# Altium schematic sheet rev-b1_pod_1_Power.SchDoc
size 297 x 209 mm; Symbol: Drawing-Symbol_A4; @Project Name: Atrium_RevB1; @Page Count: 1; @Update Date: 2026-11-05; @Create Date: 2026-11-05; @Schematic Name: Schematic1; @Page No: 1; @Page Name: P1; Company: Local Forge; Version: V1.0; Page Size: A4; Drawn: Het Bhavsar; Device: Drawing-Symbol_A4; @Create Time: 20:15:11; @Update Time: 20:15:11; Border: 1; Width: 1170; Height: 825; Region Start: 1; X Region Count: 6; Y Region Count: 4; Blade Width: 10; Title Block Position: 3; @Board Name: Board1
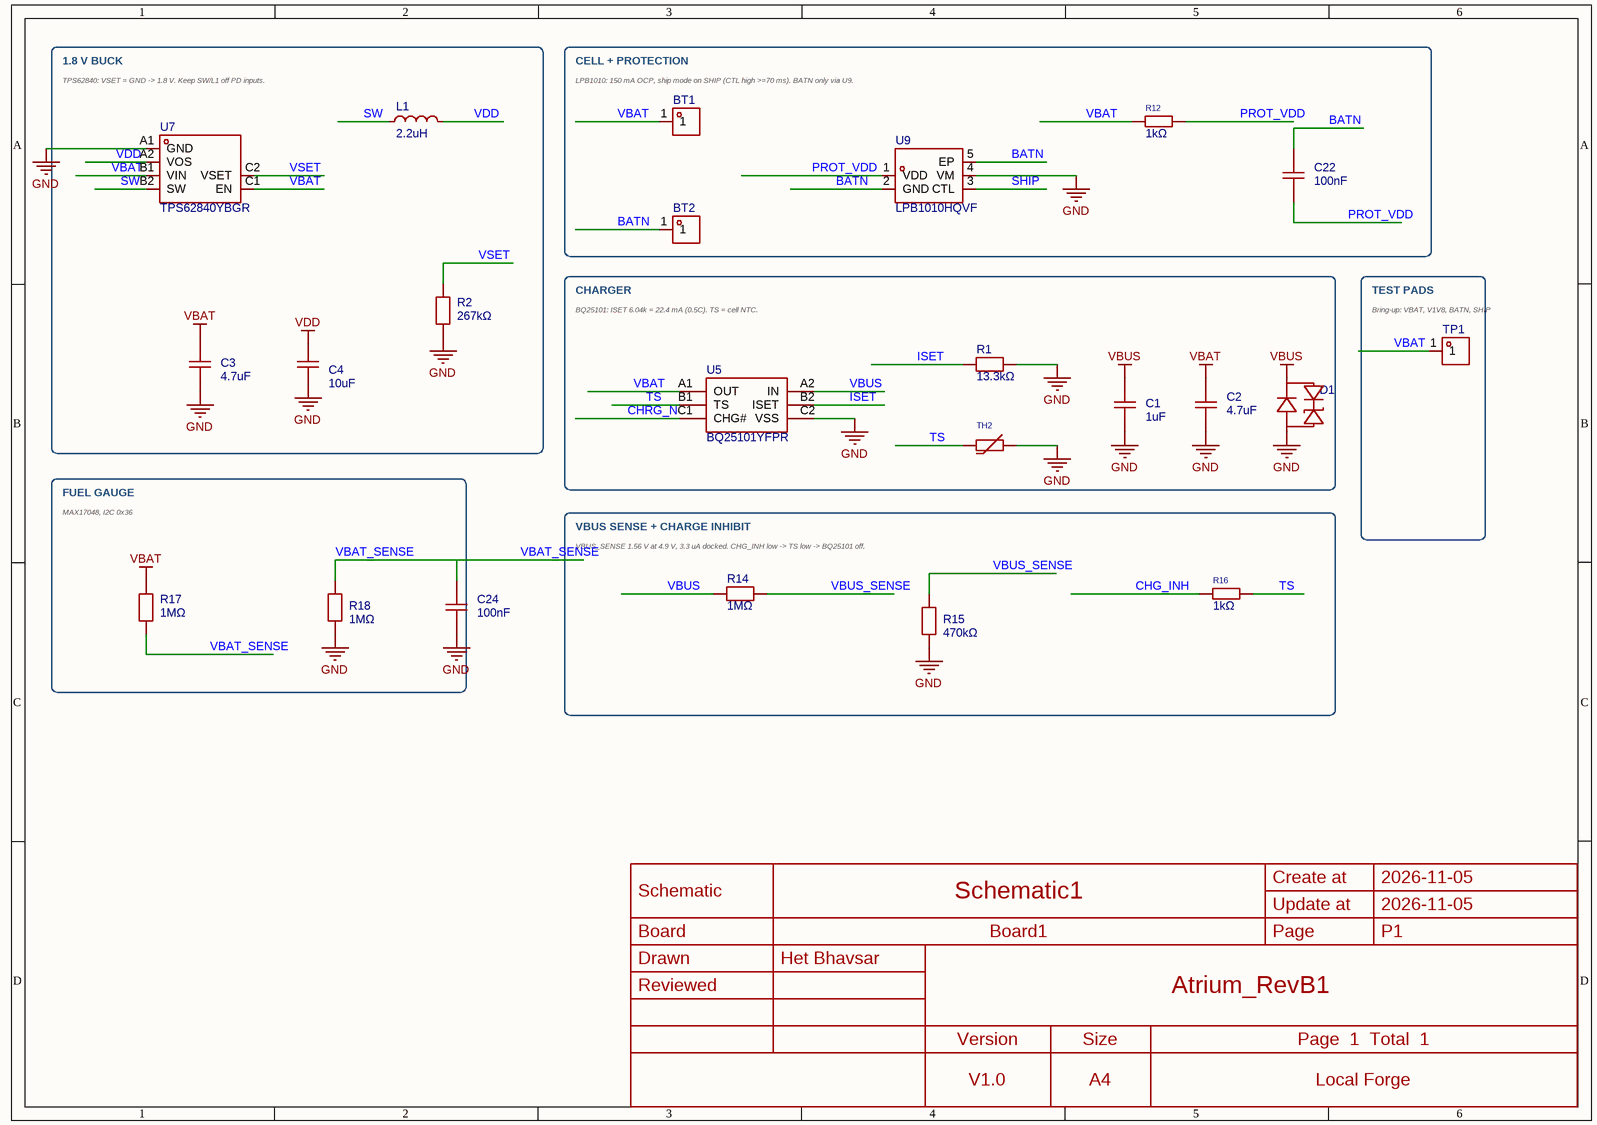
[diagram p0: rev-b1_pod_1_Power.SchDoc]

## Parts
BT1  YZR0154-15039-02  [TESTPOINT-SMD_BD1.5-H3.9]  (value not drawn)
BT2  YZR0154-15039-02  [TESTPOINT-SMD_BD1.5-H3.9]  (value not drawn)
C1  1uF  [C0201]
C2  4.7uF  [C0402]
C3  4.7uF  [C0402]
C4  10uF  [C0402]
C22  100nF  [C0201]
C24  100nF  [C0201]
D1  ESD5V3U04-0201  [X3-DFN0603-2_L0.6-W0.3-RD]  (value not drawn)
L1  2.2uH  [IND-SMD_L1.6-W0.8-1]
R1  13.3kΩ  [R0201]
R2  267kΩ  [R0201]
R12  1kΩ  [R0201]
R14  1MΩ  [R0201]
R15  470kΩ  [R0201]
R16  1kΩ  [R0201]
R17  1MΩ  [R0201]
R18  1MΩ  [R0201]
TH2  NCP03XH103F05RL  [R0201]  (value not drawn)
TP1  YZR0154-15039-02  [TESTPOINT-SMD_BD1.5-H3.9]  (value not drawn)
U5  BQ25101YFPR  [DSBGA-6_L0.9-W1.6-R2-C3-P0.40-BL]
U7  TPS62840YBGR  [DSBGA-6_L1.4-W1.0-R2-C3-P0.40-BL]
U9  LPB1010HQVF  [XDFN-4_L1.0-W1.0-P0.65-BL-EP]

## Blocks framed on the sheet
1.8 V BUCK: C3 C4 L1 R2 U7
CELL + PROTECTION: BT1 BT2 C22 R12 U9
CHARGER: C1 C2 D1 R1 TH2 U5
TEST PADS: TP1
FUEL GAUGE: C24 R17 R18
VBUS SENSE + CHARGE INHIBIT: R14-R16

## Nets
GND: C1.2 C2.2 C3.2 C4.2 C24.1 D1.2(A) R1.2 R2.2 R15.2 R18.2 TH2.2 U5.C2(VSS) U7.A1(GND) U9.4(VM)
VBAT: BT1.1 C2.1 C3.1 R12.1 R17.1 TP1.1 U5.A1(OUT) U7.B1(VIN) U7.C1(EN)
VBUS: C1.1 D1.1(K) R14.1 U5.A2(IN)
VDD: C4.1 L1.2 U7.A2(VOS)
BATN: BT2.1 C22.2 U9.2(GND) U9.5(EP)
CHG_INH: R16.1
CHRG_N: U5.C1(CHG#)
ISET: R1.1 U5.B2(ISET)
PROT_VDD: C22.1 R12.2 U9.1(VDD)
SHIP: U9.3(CTL)
SW: L1.1 U7.B2(SW)
TS: R16.2 TH2.1 U5.B1(TS)
VBAT_SENSE: C24.2 R17.2 R18.1
VBUS_SENSE: R14.2 R15.1
VSET: R2.1 U7.C2(VSET)

## Notes on the sheet
- TPS62840: VSET = GND -> 1.8 V. Keep SW/L1 off PD inputs.
- (near BT1) LPB1010: 150 mA OCP, ship mode on SHIP (CTL high >=70 ms). BATN only via U9.
- BQ25101: ISET 6.04k = 22.4 mA (0.5C). TS = cell NTC.
- (near TP1) Bring-up: VBAT, V1V8, BATN, SHIP
- MAX17048, I2C 0x36
- (near R14) VBUS_SENSE 1.56 V at 4.9 V, 3.3 uA docked. CHG_INH low -> TS low -> BQ25101 off.
- Create at
- 2026-11-05
- Schematic
- Board
- Schematic1
- Board1
- Update at
- Page
- P1
- Drawn
- Reviewed
- Het Bhavsar
- Atrium_RevB1
- Version
- V1.0
- Size
- A4
- Page  1  Total  1
- Local Forge

## Library data of the parts
BT1 BT2 TP1 = YZR0154-15039-02: Type:Pogo Pin Number of Pins:1P Overall Length/Height:3.9mm Operational Height:3.1mm Contact Resistance:50mΩ Elastic Life:10000 times Current Rating:1A Voltage Rating:12V Contact Material:Lead-Free Copper Contact Plating:Gold Operating Temperature:-20℃~+7; Manufacturer: Xinyangze(鑫扬泽); Add into BOM: no; Overall Length/Height: 3.9mm; Operational Height: 3.1mm; Contact Resistance: 50mΩ; Current Rating: 1A; Voltage Rating: 12V; Symbol: YZR0154-15039-02; Device: YZR0154-15039-02; Convert to PCB: no; Manufacturer Part: YZR0154-15039-02; Supplier: LCSC; Supplier Part: C5157388; LCSC Part Name: POGO PIN贴片型弹簧顶针; Supplier Footprint: -; JLCPCB Part Class: Extended Part; Datasheet: https://item.szlcsc.com/datasheet/YZR0154-15039-02/5795506.html; Type: Pogo Pin; Number of Pins: 1P; Elastic Life: 10000 times; Contact Material: Lead-Free Copper; Contact Plating: Gold; Operating Temperature: -20℃~+70℃; FootprintName: TESTPOINT-SMD_BD1.5-H3.9
C1 = GRM033R61A105ME15D: Capacitance:1uF Tolerance:±20% Tolerance:±20% Voltage Rating:10V Temperature Coefficient:X5R; Manufacturer: muRata(村田); Add into BOM: yes; Tolerance: ±20%; Voltage Rating: 10V; Temperature Coefficient: X5R; ModelId: c3e75c3d90204c70b153866ab54c789f0819f05c4eef4c71ace90d822a990e87; ModelName: C0201_L0.6-W0.3-H0.3; ModelTransform: 23.622,11.811,0,0,0,0,0,0,0; Symbol: GRM033R61A105ME15D; Device: GRM033R61A105ME15D; Convert to PCB: yes; Manufacturer Part: GRM033R61A105ME15D; Supplier: LCSC; Supplier Part: C181054; LCSC Part Name: 1uF ±20% 10V; Supplier Footprint: 0201; JLCPCB Part Class: Extended Part; Datasheet: https://item.szlcsc.com/datasheet/GRM033R61A105ME15D/192451.html; Value: 1uF; FootprintName: C0201
C2 C3 = CL05A475MP5NRNC: Capacitance:4.7uF Tolerance:±20% Tolerance:±20% Voltage Rating:10V Temperature Coefficient:X5R; Manufacturer: SAMSUNG(三星); Add into BOM: yes; Tolerance: ±20%; Voltage Rating: 10V; Temperature Coefficient: X5R; ModelId: b7d13df3e9464d7a99d0651d1a5b4d570819f05c4eef4c71ace90d822a990e87; ModelName: C0402_L1.0-W0.5-H0.5; ModelTransform: 39.37,19.685,0,0,0,0,0,0,0; Symbol: CL05A475MP5NRNC; Device: CL05A475MP5NRNC; Convert to PCB: yes; Manufacturer Part: CL05A475MP5NRNC; Supplier: LCSC; Supplier Part: C23733; LCSC Part Name: 4.7uF ±20% 10V; Supplier Footprint: 0402; JLCPCB Part Class: Basic Part; Datasheet: https://item.szlcsc.com/datasheet/CL05A475MP5NRNC/24469.html; Value: 4.7uF; FootprintName: C0402
C4 = CL05A106MQ5NUNC: Capacitance:10uF Tolerance:±20% Tolerance:±20% Voltage Rating:6.3V Temperature Coefficient:X5R; Manufacturer: SAMSUNG(三星); Add into BOM: yes; Tolerance: ±20%; Voltage Rating: 6.3V; Temperature Coefficient: X5R; ModelId: b7d13df3e9464d7a99d0651d1a5b4d570819f05c4eef4c71ace90d822a990e87; ModelName: C0402_L1.0-W0.5-H0.5; ModelTransform: 39.37,19.685,0,0,0,0,0,0,0; Symbol: CL05A106MQ5NUNC; Device: CL05A106MQ5NUNC; Convert to PCB: yes; Manufacturer Part: CL05A106MQ5NUNC; Supplier: LCSC; Supplier Part: C15525; LCSC Part Name: 10uF ±20% 6.3V; Supplier Footprint: 0402; JLCPCB Part Class: Basic Part; Datasheet: https://item.szlcsc.com/datasheet/CL05A106MQ5NUNC/16204.html; Value: 10uF; FootprintName: C0402
C22 = CL03A104KO3NNNC: Capacitance:100nF Tolerance:±10% Tolerance:±10% Voltage Rating:16V Temperature Coefficient:X5R; Manufacturer: SAMSUNG(三星); Add into BOM: yes; Tolerance: ±10%; Voltage Rating: 16V; Temperature Coefficient: X5R; ModelId: c3e75c3d90204c70b153866ab54c789f0819f05c4eef4c71ace90d822a990e87; ModelName: C0201_L0.6-W0.3-H0.3; ModelTransform: 23.622,11.811,0,0,0,0,0,0,0; Symbol: CL03A104KO3NNNC; Device: CL03A104KO3NNNC; Convert to PCB: yes; Manufacturer Part: CL03A104KO3NNNC; Supplier: LCSC; Supplier Part: C307380; LCSC Part Name: 100nF ±10% 16V; Supplier Footprint: 0201; JLCPCB Part Class: Extended Part; Datasheet: https://item.szlcsc.com/datasheet/CL03A104KO3NNNC/291054.html; Value: 100nF; FootprintName: C0201
C24 = CL03A104KO3NNNC: Capacitance:100nF Tolerance:±10% Tolerance:±10% Voltage Rating:16V Temperature Coefficient:X5R; Manufacturer: SAMSUNG(三星); Add into BOM: yes; 3D Model: c3e75c3d90204c70b153866ab54c789f0819f05c4eef4c71ace90d822a990e87; 3D Model Transform: 23.622,11.811,0,0,0,0,0,0,0; Tolerance: ±10%; Voltage Rating: 16V; Temperature Coefficient: X5R; ModelName: C0201_L0.6-W0.3-H0.3; Symbol: CL03A104KO3NNNC; Device: CL03A104KO3NNNC; Convert to PCB: yes; LCSC Part Name: 100nF ±10% 16V; Supplier Part: C307380; Manufacturer Part: CL03A104KO3NNNC; Supplier Footprint: 0201; JLCPCB Part Class: Extended Part; Datasheet: https://item.szlcsc.com/datasheet/CL03A104KO3NNNC/291054.html; Supplier: LCSC; Value: 100nF; FootprintName: C0201
D1 = ESD5V3U04-0201: Polarity:Unidirectional Reverse Stand-Off Voltage (Vrwm):5.3V Clamping Voltage:15V Peak Pulse Current (Ipp):3A@8/20us Reverse Leakage Current (Ir):10nA level of protection:IEC 61000-4-4；IEC 61000-4-5；IEC 61000-4-2 Type:ESD Junction Capacitance:0.4pF; Manufacturer: TECH PUBLIC(台舟); Add into BOM: yes; Reverse Stand-Off Voltage (Vrwm): 5.3V; Clamping Voltage: 15V; Reverse Leakage Current (Ir): 10nA; Type: ESD; Junction Capacitance: 0.4pF; ModelId: 3709796f0342448b909f7538c3b856250819f05c4eef4c71ace90d822a990e87; ModelName: X3-DFN0603-2_L0.6-W0.3-H0.3-RD; ModelTransform: 26.18105,15.39367,0,0,0,0,0,0,0; Symbol: ESD5V3U04-0201; Device: ESD5V3U04-0201; Convert to PCB: yes; Manufacturer Part: ESD5V3U04-0201; Supplier: LCSC; Supplier Part: C521889; LCSC Part Name: 单向 5.3V截止; Supplier Footprint: 0201; JLCPCB Part Class: Extended Part; Datasheet: https://item.szlcsc.com/datasheet/ESD5V3U04-0201/539383.html; Polarity: Unidirectional; Peak Pulse Current (Ipp): 3A@8/20us; level of protection: IEC 61000-4-4；IEC 61000-4-5；IEC 61000-4-2; FootprintName: X3-DFN0603-2_L0.6-W0.3-RD
L1 = SLO160808T2R2MTT: Inductance:2.2uH Tolerance:±20% Tolerance:±20% Current Rating:900mA Current - Saturation(Isat):1.2A DC Resistance(DCR):250mΩ Type:Wire-wound inductor Application Grade:消费级; Manufacturer: Sunltech(顺磁); Add into BOM: yes; Tolerance: ±20%; Current Rating: 900mA; Current - Saturation(Isat): 1.2A; DC Resistance(DCR): 250mΩ; Application Grade: 消费级; ModelId: 23e747ab76974f20a953a6f46bb1be7d0819f05c4eef4c71ace90d822a990e87; ModelTransform: 62.992,31.496,0,0,0,0,0,-0.005,0; Symbol: SLO160808T2R2MTT; Device: SLO160808T2R2MTT; Convert to PCB: yes; Manufacturer Part: SLO160808T2R2MTT; Supplier: LCSC; Supplier Part: C5224594; LCSC Part Name: 2.2uH ±20%; Supplier Footprint: 0603; JLCPCB Part Class: Extended Part; Datasheet: https://item.szlcsc.com/datasheet/SLO160808T2R2MTT/5927620.html; Value: 2.2uH; Type: Wire-wound inductor; FootprintName: IND-SMD_L1.6-W0.8-1; ModelName: IND-SMD_L1.6-W0.8-1
R1 = 0201WMF1332TEE: Type:Thick Film Resistor Resistance:13.3kΩ Tolerance:±1% Tolerance:±1% Power(Watts):50mW Voltage-Supply(Max):25V Temperature Coefficient:±200ppm/℃ Temperature Coefficient:±200ppm/℃ Operating Temperature:-55℃~+155℃ Operating Temperature:-55℃~+155℃; Manufacturer: UNI-ROYAL(厚声); Add into BOM: yes; Tolerance: ±1%; Power(Watts): 50mW; Voltage-Supply(Max): 25V; ModelId: d3c6830bf3df48b598874c11a7d9c8170819f05c4eef4c71ace90d822a990e87; ModelName: R0201_L0.6-W0.3-H0.3; ModelTransform: 23.622,11.811,0,0,0,0,0,-0.0005,0; Symbol: 0201WMF1332TEE; Device: 0201WMF1332TEE; Convert to PCB: yes; Manufacturer Part: 0201WMF1332TEE; Supplier: LCSC; Supplier Part: C423749; LCSC Part Name: 13.3kΩ ±1% 50mW 厚膜电阻; Supplier Footprint: 0201; JLCPCB Part Class: Extended Part; Datasheet: https://item.szlcsc.com/datasheet/0201WMF1332TEE/416699.html; Type: Thick Film Resistor; Value: 13.3kΩ; Temperature Coefficient: ±200ppm/℃; Operating Temperature: -55℃~+155℃; FootprintName: R0201
R2 = 0201WMF2673TEE: Type:Thick Film Resistor Resistance:267kΩ Tolerance:±1% Tolerance:±1% Power(Watts):50mW Voltage-Supply(Max):25V Temperature Coefficient:±200ppm/℃ Temperature Coefficient:±200ppm/℃ Operating Temperature:-55℃~+155℃ Operating Temperature:-55℃~+155℃; Manufacturer: UNI-ROYAL(厚声); Add into BOM: yes; Tolerance: ±1%; Power(Watts): 50mW; Voltage-Supply(Max): 25V; ModelId: d3c6830bf3df48b598874c11a7d9c8170819f05c4eef4c71ace90d822a990e87; ModelName: R0201_L0.6-W0.3-H0.3; ModelTransform: 23.622,11.811,0,0,0,0,0,-0.0005,0; Symbol: 0201WMF2673TEE; Device: 0201WMF2673TEE; Convert to PCB: yes; Manufacturer Part: 0201WMF2673TEE; Supplier: LCSC; Supplier Part: C423627; LCSC Part Name: 267kΩ ±1% 50mW 厚膜电阻; Supplier Footprint: 0201; JLCPCB Part Class: Extended Part; Datasheet: https://item.szlcsc.com/datasheet/0201WMF2673TEE/416577.html; Type: Thick Film Resistor; Value: 267kΩ; Temperature Coefficient: ±200ppm/℃; Operating Temperature: -55℃~+155℃; FootprintName: R0201
R12 = 0201WMF1001TEE: Type:Thick Film Resistor Resistance:1kΩ Tolerance:±1% Tolerance:±1% Power(Watts):50mW Voltage-Supply(Max):25V Temperature Coefficient:±200ppm/℃ Temperature Coefficient:±200ppm/℃ Operating Temperature:-55℃~+155℃ Operating Temperature:-55℃~+155℃; Manufacturer: UNI-ROYAL(厚声); Add into BOM: yes; Tolerance: ±1%; Power(Watts): 50mW; Voltage-Supply(Max): 25V; ModelId: d3c6830bf3df48b598874c11a7d9c8170819f05c4eef4c71ace90d822a990e87; ModelName: R0201_L0.6-W0.3-H0.3; ModelTransform: 23.622,11.811,0,0,0,0,0,-0.0005,0; Symbol: 0201WMF1001TEE; Device: 0201WMF1001TEE; Convert to PCB: yes; Manufacturer Part: 0201WMF1001TEE; Supplier: LCSC; Supplier Part: C270365; Value: 1kΩ; JLCPCB Part Class: Extended Part; LCSC Part Name: 1kΩ ±1% 50mW 厚膜电阻; Supplier Footprint: 0201; Datasheet: https://item.szlcsc.com/datasheet/0201WMF1001TEE/259895.html; Type: Thick Film Resistor; Temperature Coefficient: ±200ppm/℃; Operating Temperature: -55℃~+155℃; FootprintName: R0201
R14 = 0201WMF1004TEE: Type:Thick Film Resistors Resistance:1MΩ Tolerance:±1% Tolerance:±1% Power(Watts): Overload Voltage (Max): Temperature Coefficient:±200ppm/℃ Temperature Coefficient:±200ppm/℃ Operating Temperature Range:-55℃~+155℃ Operating Temperature Range:-55℃~+155℃; Manufacturer: UNI-ROYAL(厚声); Add into BOM: yes; Tolerance: ±1%; ModelId: d3c6830bf3df48b598874c11a7d9c8170819f05c4eef4c71ace90d822a990e87; ModelName: R0201_L0.6-W0.3-H0.3; ModelTransform: 23.622,11.811,0,0,0,0,0,-0.0005,0; Symbol: 0201WMF1004TEE; Device: 0201WMF1004TEE; Convert to PCB: yes; Manufacturer Part: 0201WMF1004TEE; Supplier: LCSC; Supplier Part: C473482; LCSC Part Name: 1MΩ ±1% 50mW 厚膜电阻; Supplier Footprint: 0201; JLCPCB Part Class: Extended Part; Datasheet: https://atta.szlcsc.com/upload/public/pdf/source/20200306/C422600_1E6D84923E4A46A82E41ADD87F860B5C.pdf; Type: Thick Film Resistors; Value: 1MΩ; Temperature Coefficient: ±200ppm/℃; Operating Temperature Range: -55℃~+155℃; FootprintName: R0201
R15 = 0201WMF4703TEE: Type:Thick Film Resistor Resistance:470kΩ Tolerance:±1% Tolerance:±1% Power(Watts):50mW Voltage-Supply(Max):25V Temperature Coefficient:±200ppm/℃ Temperature Coefficient:±200ppm/℃ Operating Temperature:-55℃~+155℃ Operating Temperature:-55℃~+155℃; Manufacturer: UNI-ROYAL(厚声); Add into BOM: yes; Tolerance: ±1%; Power(Watts): 50mW; Voltage-Supply(Max): 25V; ModelId: d3c6830bf3df48b598874c11a7d9c8170819f05c4eef4c71ace90d822a990e87; ModelName: R0201_L0.6-W0.3-H0.3; ModelTransform: 23.622,11.811,0,0,0,0,0,-0.0005,0; Symbol: 0201WMF4703TEE; Device: 0201WMF4703TEE; Convert to PCB: yes; Manufacturer Part: 0201WMF4703TEE; Supplier: LCSC; Supplier Part: C473560; LCSC Part Name: 470kΩ ±1% 50mW 厚膜电阻; Supplier Footprint: 0201; JLCPCB Part Class: Extended Part; Datasheet: https://item.szlcsc.com/datasheet/0201WMF4703TEE/479953.html; Type: Thick Film Resistor; Value: 470kΩ; Temperature Coefficient: ±200ppm/℃; Operating Temperature: -55℃~+155℃; FootprintName: R0201
R16 = 0201WMF1001TEE: Type:Thick Film Resistor Resistance:1kΩ Tolerance:±1% Tolerance:±1% Power(Watts):50mW Voltage-Supply(Max):25V Temperature Coefficient:±200ppm/℃ Temperature Coefficient:±200ppm/℃ Operating Temperature:-55℃~+155℃ Operating Temperature:-55℃~+155℃; Manufacturer: UNI-ROYAL(厚声); Add into BOM: yes; 3D Model: d3c6830bf3df48b598874c11a7d9c8170819f05c4eef4c71ace90d822a990e87; 3D Model Transform: 23.622,11.811,0,0,0,0,0,-0.0005,0; Tolerance: ±1%; Power(Watts): 50mW; Voltage-Supply(Max): 25V; ModelName: R0201_L0.6-W0.3-H0.3; Symbol: 0201WMF1001TEE; Device: 0201WMF1001TEE; Convert to PCB: yes; LCSC Part Name: 1kΩ ±1% 50mW 厚膜电阻; Supplier Footprint: 0201; Datasheet: https://item.szlcsc.com/datasheet/0201WMF1001TEE/259895.html; Type: Thick Film Resistor; Temperature Coefficient: ±200ppm/℃; Operating Temperature: -55℃~+155℃; Manufacturer Part: 0201WMF1001TEE; Supplier: LCSC; Supplier Part: C270365; Value: 1kΩ; JLCPCB Part Class: Extended Part; FootprintName: R0201
R17 R18 = 0201WMF1004TEE: Type:Thick Film Resistors Resistance:1MΩ Tolerance:±1% Tolerance:±1% Power(Watts): Overload Voltage (Max): Temperature Coefficient:±200ppm/℃ Temperature Coefficient:±200ppm/℃ Operating Temperature Range:-55℃~+155℃ Operating Temperature Range:-55℃~+155℃; Manufacturer: UNI-ROYAL(厚声); Add into BOM: yes; 3D Model: d3c6830bf3df48b598874c11a7d9c8170819f05c4eef4c71ace90d822a990e87; 3D Model Transform: 23.622,11.811,0,0,0,0,0,-0.0005,0; Tolerance: ±1%; ModelName: R0201_L0.6-W0.3-H0.3; Symbol: 0201WMF1004TEE; Device: 0201WMF1004TEE; Convert to PCB: yes; LCSC Part Name: 1MΩ ±1% 50mW 厚膜电阻; Supplier Part: C473482; Manufacturer Part: 0201WMF1004TEE; Supplier Footprint: 0201; JLCPCB Part Class: Extended Part; Datasheet: https://atta.szlcsc.com/upload/public/pdf/source/20200306/C422600_1E6D84923E4A46A82E41ADD87F860B5C.pdf; Supplier: LCSC; Type: Thick Film Resistors; Value: 1MΩ; Temperature Coefficient: ±200ppm/℃; Operating Temperature Range: -55℃~+155℃; FootprintName: R0201
TH2 = NCP03XH103F05RL: Resistance @ 25℃:10kΩ B Constant (25℃/50℃):3380K Resistance Tolerance:±1% Resistance Tolerance:±1% B Constant (25℃/85℃):3434K B Constant (25℃/100℃):3455K Power(Watts):100mW B Constant Tolerance:±1% Operating Temperature:-40℃~+125℃ Operating Temperature:-4; Manufacturer: muRata(村田); Add into BOM: yes; Value: 10KΩ; B Constant (25℃/50℃): 3380K; Resistance Tolerance: ±1%; B Constant (25℃/85℃): 3434K; B Constant (25℃/100℃): 3455K; Power(Watts): 100mW; Dissipation Factor: 1mW/℃; ModelId: d3c6830bf3df48b598874c11a7d9c8170819f05c4eef4c71ace90d822a990e87; ModelName: R0201_L0.6-W0.3-H0.3; ModelTransform: 23.622,11.811,0,0,0,0,0,-0.0005,0; Symbol: NCP03XH103F05RL; Device: NCP03XH103F05RL; Convert to PCB: yes; Manufacturer Part: NCP03XH103F05RL; Supplier: LCSC; Supplier Part: C98098; JLCPCB Part Class: Extended Part; LCSC Part Name: 10kΩ 3380K 100mW; Supplier Footprint: 0201; Datasheet: https://item.szlcsc.com/datasheet/NCP03XH103F05RL/99307.html; Resistance @ 25℃: 10kΩ; B Constant Tolerance: ±1%; Operating Temperature: -40℃~+125℃; FootprintName: R0201
U5 = BQ25101YFPR: The Chip Type:Charging IC Voltage - Supply:3.5V~28V Voltage - Supply:3.5V~28V Charge Current - Max:250mA Charging Saturation Voltage:4.2V End-Off Voltage:- Type of Battery:Lithium Battery Number of Cells:1 Number of Cells:1 Operating Temperature:0℃~+125℃; Manufacturer: TI(德州仪器); Add into BOM: yes; Charge Current - Max: 250mA; Charging Saturation Voltage: 4.2V; Number of Cells: 1; Battery Temperature Detection: Support; Supply Current (Iq): 6uA; ModelId: e3f25dbbb3ce498289a3f9076621cadf0819f05c4eef4c71ace90d822a990e87; ModelName: DSBGA-6_L0.9-W1.6-H0.5-R2-C3-P0.40-BL; ModelTransform: 62.086,34.6456,0,0,0,0,0,0,0; Symbol: BQ25101YFPR; Device: BQ25101YFPR; Convert to PCB: yes; Manufacturer Part: BQ25101YFPR; Supplier: LCSC; Supplier Part: C478468; LCSC Part Name: 250-mA单节锂离子电池充电器，1-mA终止电流，75-nA电池泄漏电流; Supplier Footprint: DSBGA-6; JLCPCB Part Class: Extended Part; Datasheet: https://www.ti.com/cn/lit/ds/symlink/bq25101.pdf; The Chip Type: Charging IC; Voltage - Supply: 3.5V~28V; End-Off Voltage: -; Type of Battery: Lithium Battery; Operating Temperature: 0℃~+125℃; 0V Battery Charge: -; Balance Current: -; Interface: -; Features: -; FootprintName: DSBGA-6_L0.9-W1.6-R2-C3-P0.40-BL
U7 = TPS62840YBGR: Function:Step-down type Voltage - Supply:1.8V~6.5V Voltage - Supply:1.8V~6.5V Output Voltage:1.8V~3.3V Output Voltage:1.8V~3.3V Output Current:750mA Frequency - Switching:1.8MHz Frequency - Switching:1.8MHz Operating Temperature:-40℃~+125℃@(TJ) Operating; Manufacturer: TI(德州仪器); Add into BOM: yes; Output Current: 750mA; Frequency - Switching: 1.8MHz; Number of Outputs: 1; Topology: Buck; Quiescent Current: 60nA; Switch tube (built-in/external): Built-in; Output Type: Adjustable; ModelId: 191fec95c3b746dcb69089723a7461920819f05c4eef4c71ace90d822a990e87; ModelName: DSBGA-6_L1.4-W1.0-H0.4-R3-C2-P0.40-BL; ModelTransform: 51.181,36.45662,0,0,0,0,0,0.003,0; Symbol: TPS62840YBGR; Device: TPS62840YBGR; Convert to PCB: yes; Manufacturer Part: TPS62840YBGR; Supplier: LCSC; Supplier Part: C2071139; LCSC Part Name: 降压型 750mA 1.8V~6.5V; Supplier Footprint: DSBGA-6(1x1.5); JLCPCB Part Class: Extended Part; Datasheet: https://www.ti.com/cn/lit/ds/symlink/tps62840.pdf; Function: Step-down type; Voltage - Supply: 1.8V~6.5V; Output Voltage: 1.8V~3.3V; Operating Temperature: -40℃~+125℃@(TJ); Synchronous Rectifier: Yes; Features: Light load efficient mode；Cycle-by-cycle current limiting；Overcurrent Protection；Output discharge; FootprintName: DSBGA-6_L1.4-W1.0-R2-C3-P0.40-BL
U9 = LPB1010HQVF: The Chip Type:Protection IC Voltage - Supply:0V~4.2V Voltage - Supply:0V~4.2V Charge Current - Max:400mA Charging Saturation Voltage:- End-Off Voltage:2.8V Type of Battery:Lithium Battery Number of Cells:1 Number of Cells:1 Operating Temperature:-40℃~+85℃; Manufacturer: LOWPOWER(微源半导体); Add into BOM: yes; Charge Current - Max: 400mA; End-Off Voltage: 2.8V; Number of Cells: 1; Battery Temperature Detection: Not supported; 0V Battery Charge: Support; Supply Current (Iq): 500nA; ModelId: 62f7011e9d014caa92e4f21f8fa009fa0819f05c4eef4c71ace90d822a990e87; ModelName: XDFN-4_L1.0-W1.0-H0.6-P0.65-BL-EP; ModelTransform: 39.37,40.1574,0,0,0,0,0.005,-0.005,0; Symbol: LPB1010HQVF; Device: LPB1010HQVF; Convert to PCB: yes; Manufacturer Part: LPB1010HQVF; Supplier: LCSC; Supplier Part: C47345803; LCSC Part Name: 单节锂电池保护集成电路，集成MOSFET; Supplier Footprint: DFN-4-EP(1x1); JLCPCB Part Class: Extended Part; Datasheet: https://item.szlcsc.com/datasheet/LPB1010HQVF/49562293.html; The Chip Type: Protection IC; Voltage - Supply: 0V~4.2V; Charging Saturation Voltage: -; Type of Battery: Lithium Battery; Operating Temperature: -40℃~+85℃; Balance Current: -; Interface: -; Features: Overcurrent Protection；Overcharge protection；Over-discharge protection；Short-Circuit  Protection; FootprintName: XDFN-4_L1.0-W1.0-P0.65-BL-EP